# EAGLE board beads_v51 (EAGLE 9.0.1)
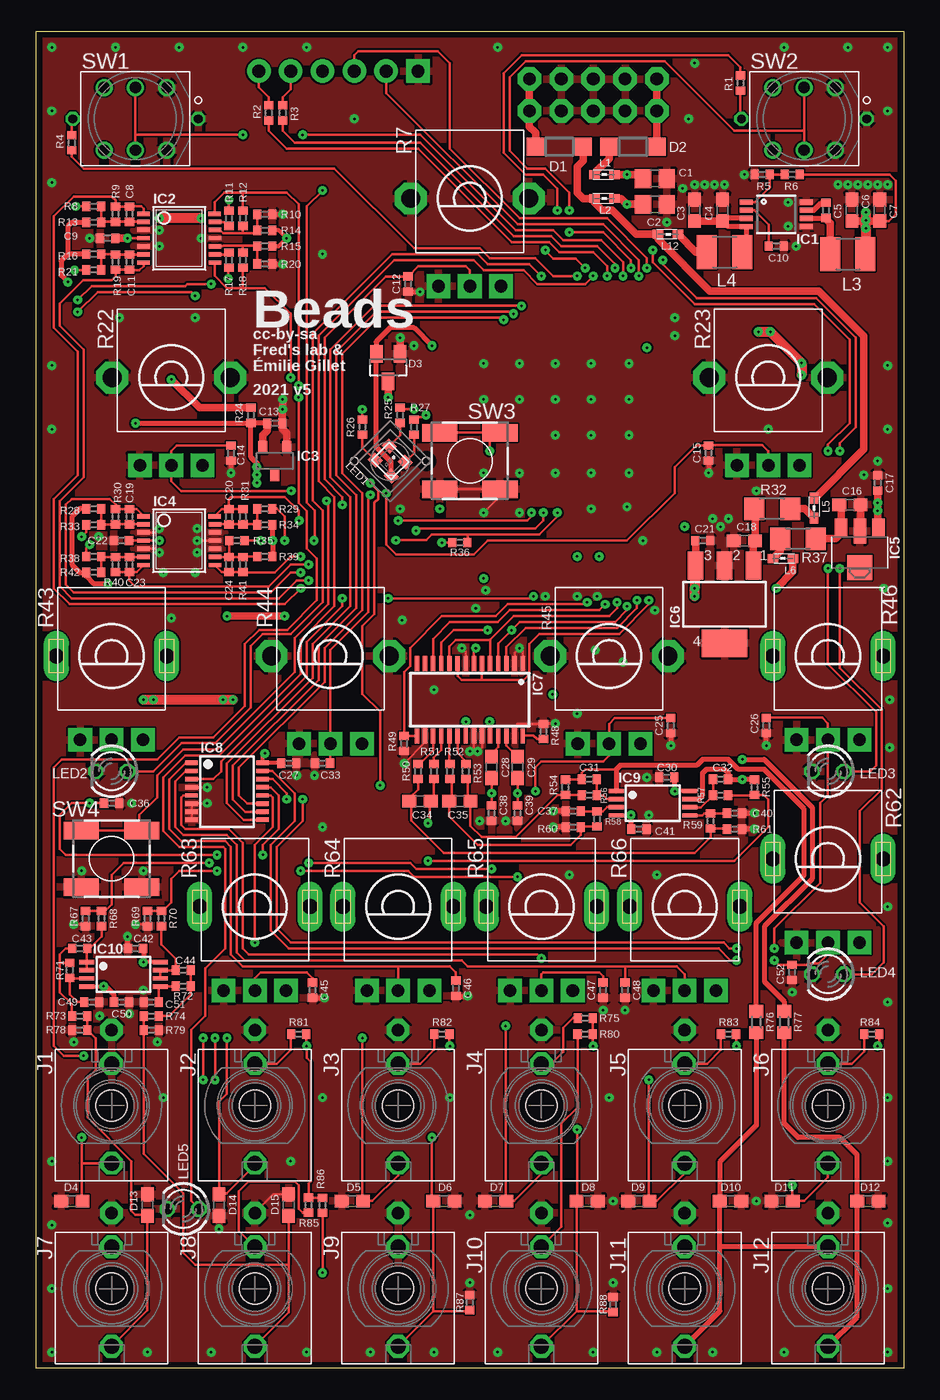
[diagram p8: board, top side]
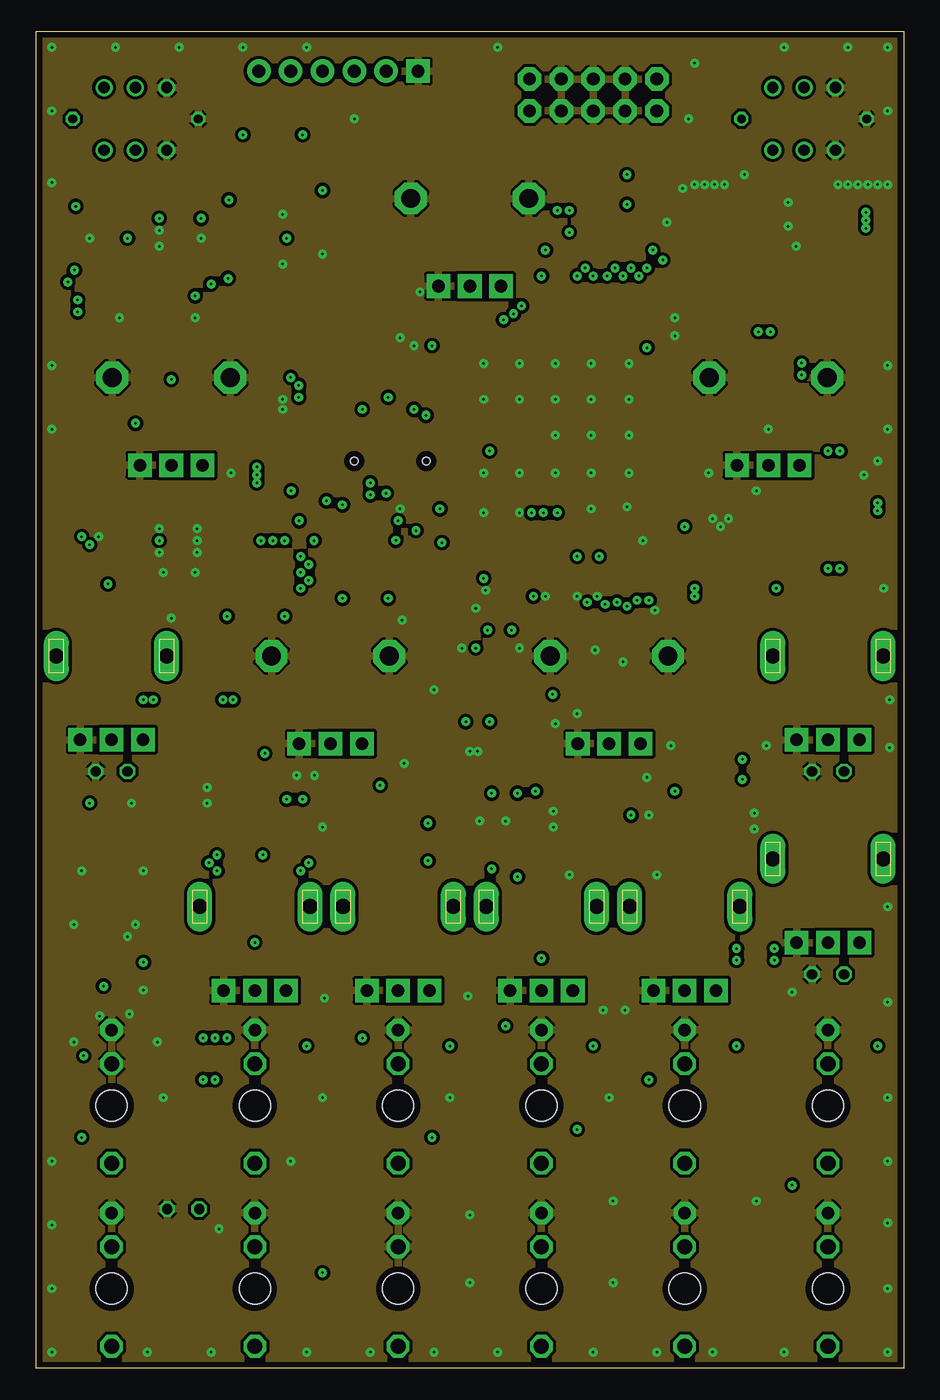
[diagram p9: board, inner layer GND]
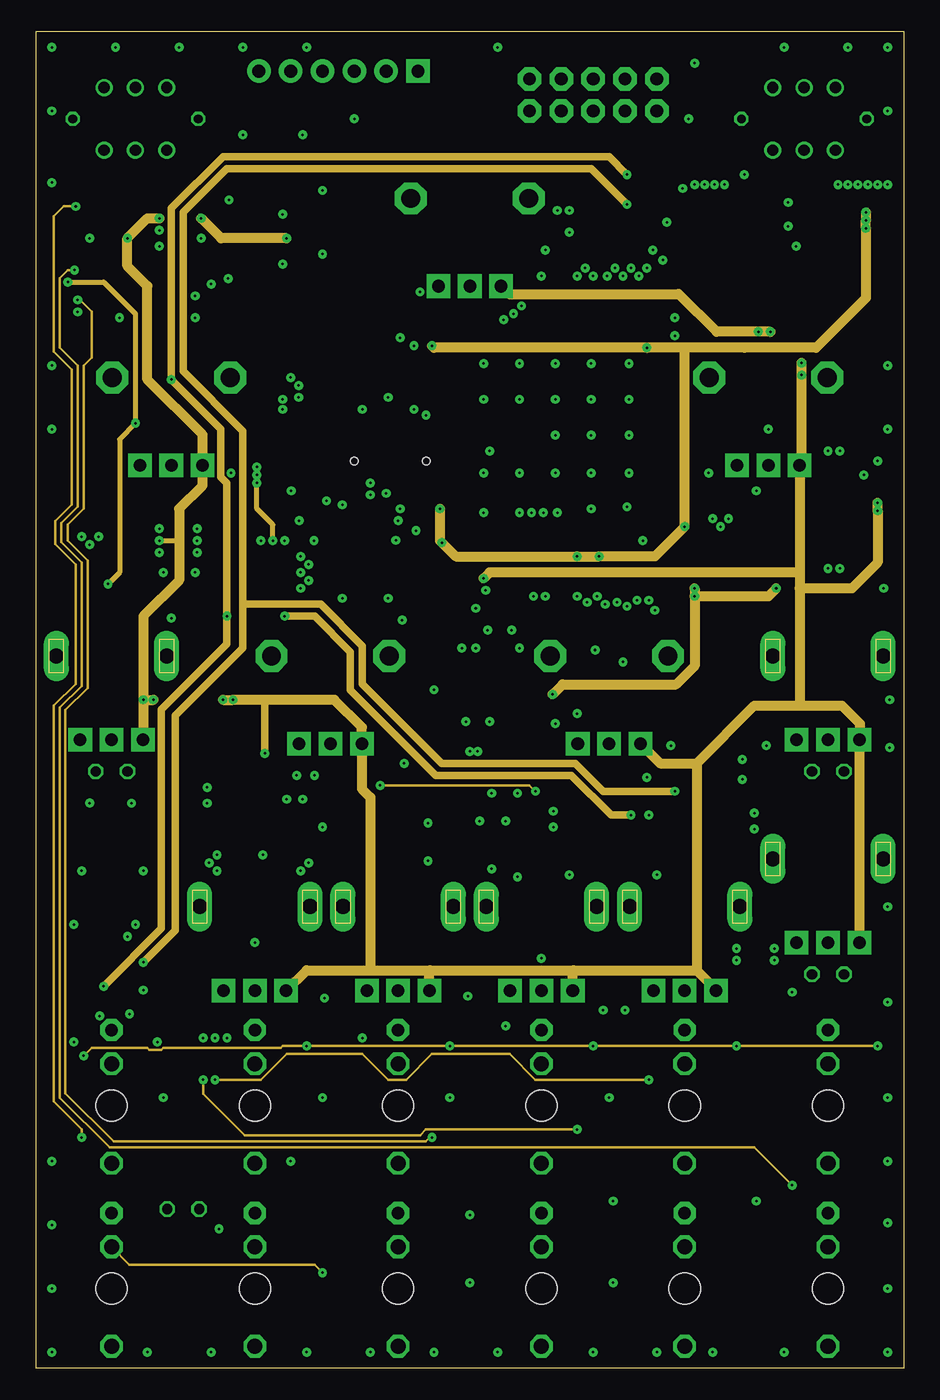
[diagram p10: board, inner layer Supplies+LongTraces]
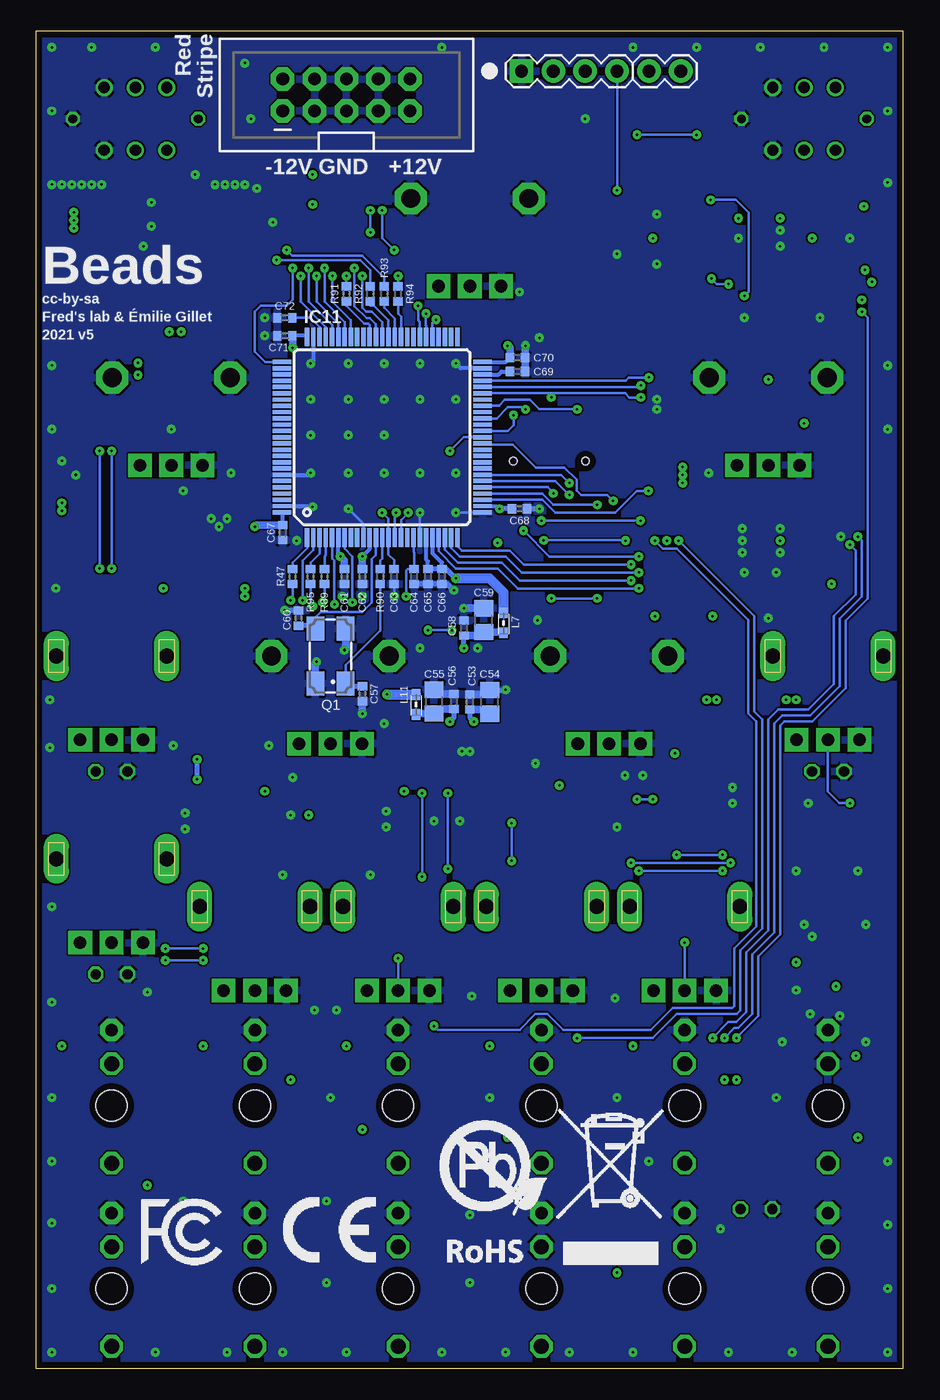
[diagram p11: board, bottom side, seen from below]

Size 69.2 x 106.68 mm. Coordinates in mm from the lower left corner, seen from the top.
Outline: 69.2,0 0,0 0,106.68 69.2,106.68 69.2,0
Copper layers (1+(2*15)+16): Top 0.035mm / dielectric 1.5mm / GND 0.035mm / dielectric 0.15mm / Supplies+LongTraces 0.035mm / dielectric 0.2mm / Bottom 0.035mm
Design rules "PCBCart-Standard-Fine *": minimum track width 8mil, minimum drill 0.2mm, track to track 5.5mil, track to pad 5.5mil, pad to pad 5.5mil, via to via 5.5mil, smd to smd 5.5mil, copper to edge 20mil, drill to drill 5.5mil, minimum pad ring 8mil, minimum via ring 10mil, stop-mask expansion 3mil, vias tented up to drill 25mil, thermal gap 8mil

## Footprints (pad centres in the part's own frame; a part is rotated, then mirrored left to right if it is on the bottom)
C0805 = smd 1.3 x 1.5: 1 -0.95,0; 2 0.95,0
C0603 = smd 1.1 x 1: 1 -0.85,0; 2 0.85,0
C0402 = smd 0.65 x 0.75: 1 -0.6,0; 2 0.6,0
SOD123 = smd 1.4 x 1.4: A 1.9,0; C -1.9,0
SOT23 = smd 1 x 1.4: 1 -0.95,-1.1; 2 0.95,-1.1; 3 0,1.1
0603 = smd 1.1 x 1: 1 -0.85,0; 2 0.85,0
MSOP-8 = smd 0.41 x 1.02: 1 -0.975,-2.4; 2 -0.325,-2.4; 3 0.325,-2.4; 4 0.975,-2.4; 5 0.975,2.4; 6 0.325,2.4; 7 -0.325,2.4; 8 -0.975,2.4
TSSOP14_065 = smd 0.35 x 1: 1 -1.95,-2.845; 2 -1.3,-2.845; 3 -0.65,-2.845; 4 0,-2.845; 5 0.65,-2.845; 6 1.3,-2.845; 7 1.95,-2.845; 8 1.95,2.845; 9 1.3,2.845; 10 0.65,2.845; 11 0,2.845; 12 -0.65,2.845; 13 -1.3,2.845; 14 -1.95,2.825
DBZ_R-PDSO-G3 = smd 0.7 x 1: 1 -0.95,-1.1; 2 0.95,-1.1; 3 0,1.1
SOT89 = smd 1 x 1.5: 1 -1.499,-1.981; 3 1.499,-1.981 | smd 1 x 2: 2 0,-1.727 | smd 2 x 2: 2@1 0,1.194
SOT223 = smd 1.219 x 2.235: 1 -2.311,-3.099; 2 0,-3.099; 3 2.311,-3.099 | smd 3.6 x 2.2: 4 0,3.099
TSSOP28 = smd 0.35 x 1.2: 1 -4.225,-2.9; 2 -3.575,-2.9; 3 -2.925,-2.9; 4 -2.275,-2.9; 5 -1.625,-2.9; 6 -0.975,-2.9; 7 -0.325,-2.9; 8 0.325,-2.9; 9 0.975,-2.9; 10 1.625,-2.9; 11 2.275,-2.9; 12 2.925,-2.9; 13 3.575,-2.9; 14 4.225,-2.9; 15 4.225,2.9; 16 3.575,2.9; 17 2.925,2.9; 18 2.275,2.9; 19 1.625,2.9; 20 0.975,2.9; 21 0.325,2.9; 22 -0.325,2.9; 23 -0.975,2.9; 24 -1.625,2.9; 25 -2.275,2.9; 26 -2.925,2.9; 27 -3.575,2.9; 28 -4.225,2.9
TSSOP16_065 = smd 0.35 x 1: 1 -1.95,-2.825; 2 -1.3,-2.825; 3 -0.65,-2.825; 4 0,-2.825; 5 0.65,-2.825; 6 1.3,-2.825; 7 1.95,-2.825; 8 2.6,-2.825; 9 2.6,2.825; 10 1.95,2.825; 11 1.3,2.825; 12 0.65,2.825; 13 0,2.825; 14 -0.65,2.825; 15 -1.3,2.825; 16 -1.95,2.825
TSSOP08 = smd 0.35 x 1.2: 1 -0.975,-2.925; 2 -0.325,-2.925; 3 0.325,-2.925; 4 0.975,-2.925; 5 0.975,2.925; 6 0.325,2.925; 7 -0.325,2.925; 8 -0.975,2.925
TQFP100 = smd 1.5 x 0.35: 1 -8,6; 2 -8,5.5; 3 -8,5; 4 -8,4.5; 5 -8,4; 6 -8,3.5; 7 -8,3; 8 -8,2.5; 9 -8,2; 10 -8,1.5; 11 -8,1; 12 -8,0.5; 13 -8,0; 14 -8,-0.5; 15 -8,-1; 16 -8,-1.5; 17 -8,-2; 18 -8,-2.5; 19 -8,-3; 20 -8,-3.5; 21 -8,-4; 22 -8,-4.5; 23 -8,-5; 24 -8,-5.5; 25 -8,-6; 51 8,-6; 52 8,-5.5; 53 8,-5; 54 8,-4.5; 55 8,-4; 56 8,-3.5; 57 8,-3; 58 8,-2.5; 59 8,-2; 60 8,-1.5; 61 8,-1; 62 8,-0.5; 63 8,0; 64 8,0.5; 65 8,1; 66 8,1.5; 67 8,2; 68 8,2.5; 69 8,3; 70 8,3.5; 71 8,4; 72 8,4.5; 73 8,5; 74 8,5.5; 75 8,6 | smd 0.35 x 1.5: 26 -6,-8; 27 -5.5,-8; 28 -5,-8; 29 -4.5,-8; 30 -4,-8; 31 -3.5,-8; 32 -3,-8; 33 -2.5,-8; 34 -2,-8; 35 -1.5,-8; 36 -1,-8; 37 -0.5,-8; 38 0,-8; 39 0.5,-8; 40 1,-8; 41 1.5,-8; 42 2,-8; 43 2.5,-8; 44 3,-8; 45 3.5,-8; 46 4,-8; 47 4.5,-8; 48 5,-8; 49 5.5,-8; 50 6,-8; 76 6,8; 77 5.5,8; 78 5,8; 79 4.5,8; 80 4,8; 81 3.5,8; 82 3,8; 83 2.5,8; 84 2,8; 85 1.5,8; 86 1,8; 87 0.5,8; 88 0,8; 89 -0.5,8; 90 -1,8; 91 -1.5,8; 92 -2,8; 93 -2.5,8; 94 -3,8; 95 -3.5,8; 96 -4,8; 97 -4.5,8; 98 -5,8; 99 -5.5,8; 100 -6,8
WQP_PJ_301M_TME = drill 1 pad 1.778 octagon: P1 0,-6.032 | drill 1.2 pad 1.778 octagon: P2 0,-3.334; P3 0,4.604 | hole 2.5: 0,0
2X5-SHROUDED = drill 1.016 pad 1.88 octagon: 1 -1.27,5.08; 2 1.27,5.08; 3 -1.27,2.54; 4 1.27,2.54; 5 -1.27,0; 6 1.27,0; 7 -1.27,-2.54; 8 1.27,-2.54; 9 -1.27,-5.08; 10 1.27,-5.08
1X04 = drill 1.016 pad 1.88 square: 1 0,0 | drill 1.016 pad 1.88: 2 2.54,0; 3 5.08,0; 4 7.62,0
1X02 = drill 1.016 pad 1.88: 1 0,0; 2 2.54,0
0603' = smd 0.85 x 0.7: 1 -0.9,0; 2 0.7,0
R1210 = smd 1.6 x 2.7: 1 -1.4,0; 2 1.4,0
PLCC-4-2220 = smd 0.9 x 0.8: 1 0.9,-0.8; 2 0.9,0.8; 3 -0.9,0.8; 4 -0.9,-0.8
LED3MM = drill 0.813 octagon: A -1.27,0; K 1.27,0
CTS406 = smd 1.9 x 1.4: 1 -2.2,-1.2; 2 2.2,-1.2; 3 2.2,1.2; 4 -2.2,1.2
R0402 = smd 0.65 x 0.75: 1 -0.6,0; 2 0.6,0
ALPS_POT_VERTICAL_PS = drill 1 pad 1.88 square: P$1 -2.5,7; P$2 0,7; P$3 2.5,7 | drill 1.5 pad 2.54 octagon: P$4 -4.7,0; P$5 4.7,0
R1206 = smd 1.6 x 1.803: 1 -1.422,0; 2 1.422,0
ALPS_POT_NARROW = drill 1 pad 1.88 square: P$1 -2.5,6.7; P$2 0,6.7; P$3 2.5,6.7 | drill 1.2 pad 2 long: P$4 -4.4,0; P$5 4.4,0
R0603 = smd 1 x 1.1: 1 -0.85,0; 2 0.85,0
LP4OA1PBCT = drill 0.7 octagon: L1 5,0; L2 -5,0 | drill 0.9: P1 2.5,2.5; P2 0,2.5; P3 -2.5,2.5; P4 2.5,-2.5; P5 0,-2.5; P6 -2.5,-2.5
TACTILE_SWITCH_SMD_JLEAD = smd 2.8 x 1.4: 1 -2.41,2.25; 2 2.41,2.25; 3 -2.41,-2.25; 4 2.41,-2.25
VLP-XXX-X = hole 0.6: 2.032,2.032; -2.032,-2.032

## Placement (x,y rotation side)
C1  10u  [C0805]  49.35,94.93 180 top
C2  10u  [C0805]  49.35,92.87 0 top
C3  10u  [C0603]  52.53,92.39 90 top
C4  10u  [C0603]  54.75,92.39 90 top
C5  100n  [C0402]  63,92.39 270 top
C6  10u  [C0603]  65.07,92.39 90 top
C7  10u  [C0603]  67.29,92.39 90 top
C8  1.0n  [C0402]  7.44,92.08 90 top
C9  100n  [C0402]  5.7,90.17 180 top
C10  2.2u  [C0402]  59.03,89.53 0 top
C11  1.0n  [C0402]  7.44,88.27 270 top
C12  100n  [C0402]  29.67,86.52 270 top
C13  100n  [C0402]  19.03,75.41 0 top
C14  100n  [C0402]  15.54,73.03 270 top
C15  100n  [C0402]  53.64,73.03 270 top
C16  10u  [C0603]  64.91,68.9 0 top
C17  2.2u  [C0402]  67.13,70.64 90 top
C18  10u  [C0603]  56.49,66.04 180 top
C19  1.0n  [C0402]  7.44,67.94 90 top
C20  2.2n  [C0402]  15.38,67.94 90 top
C21  100n  [C0402]  53.16,66.04 0 top
C22  100n  [C0402]  6.81,66.04 180 top
C23  2.2n  [C0402]  7.44,64.14 270 top
C24  2.2n  [C0402]  15.38,64.14 270 top
C25  100n  [C0402]  50.62,51.28 270 top
C26  100n  [C0402]  58.24,51.28 270 top
C27  100n  [C0402]  20.14,48.26 0 top
C28  10u  [C0603]  36.33,47.94 90 top
C29  10u  [C0603]  38.4,47.94 90 top
C30  100n  [C0402]  50.3,47.15 180 top
C31  220p  [C0402]  44.11,46.99 180 top
C32  220p  [C0402]  54.59,46.99 0 top
C33  100n  [C0402]  22.84,48.26 180 top
C34  2.2n  [C0603]  30.62,45.24 180 top
C35  2.2n  [C0603]  33.79,45.24 180 top
C36  100n  [C0402]  6.01,45.09 0 top
C37  220p  [C0402]  42.84,44.45 180 top
C38  1.2n  [C0402]  36.33,44.29 270 top
C39  1.2n  [C0402]  38.4,44.29 270 top
C40  220p  [C0402]  55.7,44.29 0 top
C41  100n  [C0402]  48.08,43.02 180 top
C42  100n  [C0402]  7.92,33.5 180 top
C43  680p  [C0402]  3.47,33.5 0 top
C44  680p  [C0402]  11.73,31.75 180 top
C45  100n  [C0402]  22.05,30.16 270 top
C46  100n  [C0402]  33.48,30.32 270 top
C47  100n  [C0402]  45.22,30.16 270 top
C48  100n  [C0402]  46.97,30.16 270 top
C49  330p  [C0402]  4.43,29.21 0 top
C50  100n  [C0402]  6.81,29.21 180 top
C51  330p  [C0402]  9.19,29.21 180 top
C52  100n  [C0402]  60.3,31.59 270 top
C53  100n  [C0402]  34.59,53.17 90 bottom
C54  47u  [C0805]  33,53.17 90 bottom
C55  47u  [C0805]  37.45,53.19 90 bottom
C56  100n  [C0402]  35.86,53.19 90 bottom
C57  18p  [C0402]  43.16,53.82 270 bottom
C58  100n  [C0402]  35.06,59.06 90 bottom
C59  47u  [C0805]  33.48,59.69 90 bottom
C60  18p  [C0402]  48.24,59.85 90 bottom
C61  100n  [C0402]  44.59,63.18 270 bottom
C62  100n  [C0402]  43.16,63.18 270 bottom
C63  100n  [C0402]  40.62,63.18 270 bottom
C64  1.2n  [C0402]  39.03,63.18 270 bottom
C65  100n  [C0402]  37.92,63.18 270 bottom
C66  2.2u  [C0402]  36.81,63.18 270 bottom
C67  100n  [C0402]  49.51,66.67 270 bottom
C68  100n  [C0402]  30.62,68.58 0 bottom
C69  2.2u  [C0402]  30.78,79.53 0 bottom
C70  100n  [C0402]  30.78,80.64 0 bottom
C71  100n  [C0402]  49.35,82.39 180 bottom
C72  2.2u  [C0402]  49.35,83.82 180 bottom
D1  1N5819HW  [SOD123]  41.73,97.47 180 top
D2  1N5819HW  [SOD123]  47.6,97.47 180 top
D3  BAT54S  [SOT23]  28.08,79.85 180 top
D4  16V  [0603]  2.84,13.34 0 top
D5  16V  [0603]  25.22,13.34 0 top
D6  16V  [0603]  32.52,13.34 180 top
D7  16V  [0603]  36.65,13.34 0 top
D8  16V  [0603]  43.95,13.34 180 top
D9  16V  [0603]  48.08,13.34 0 top
D10  16V  [0603]  55.38,13.34 180 top
D11  16V  [0603]  59.51,13.34 0 top
D12  16V  [0603]  66.34,13.34 180 top
D13  16V  [0603]  8.87,13.02 270 top
D14  16V  [0603]  14.59,13.02 90 top
D15  16V  [0603]  20.14,13.02 270 top
IC1  MCP16311MS  [MSOP-8]  59.03,92.08 270 top
IC2  MCP6004  [TSSOP14_065]  11.41,90.17 270 top
IC3  LM4040B10  [DBZ_R-PDSO-G3]  19.03,72.39 180 top
IC4  MCP6004  [TSSOP14_065]  11.41,66.04 270 top
IC5  LD2981ABU33  [SOT89]  65.7,65.09 180 top
IC6  UA78M05DCY  [SOT223]  54.91,60.96 180 top
IC7  PCM3060  [TSSOP28]  34.59,53.34 180 top
IC8  4051PW  [TSSOP16_065]  15.22,46.35 270 top
IC9  NJM2068  [TSSOP08]  49.19,45.09 270 top
IC10  NJM2068  [TSSOP08]  6.97,31.43 270 top
IC11  STM32H743VIT6  [TQFP100]  41.57,74.29 90 bottom
J1  PJ301_THONKICONNTME  [WQP_PJ_301M_TME]  6.01,20.95 180 top
J2  PJ301_THONKICONNTME  [WQP_PJ_301M_TME]  17.44,20.95 180 top
J3  PJ301_THONKICONNTME  [WQP_PJ_301M_TME]  28.87,20.95 180 top
J4  PJ301_THONKICONNTME  [WQP_PJ_301M_TME]  40.3,20.95 180 top
J5  PJ301_THONKICONNTME  [WQP_PJ_301M_TME]  51.73,20.95 180 top
J6  PJ301_THONKICONNTME  [WQP_PJ_301M_TME]  63.16,20.95 180 top
J7  PJ301_THONKICONNTME  [WQP_PJ_301M_TME]  6.01,6.35 180 top
J8  PJ301_THONKICONNTME  [WQP_PJ_301M_TME]  17.44,6.35 180 top
J9  PJ301_THONKICONNTME  [WQP_PJ_301M_TME]  28.87,6.35 180 top
J10  PJ301_THONKICONNTME  [WQP_PJ_301M_TME]  40.3,6.35 180 top
J11  PJ301_THONKICONNTME  [WQP_PJ_301M_TME]  51.73,6.35 180 top
J12  PJ301_THONKICONNTME  [WQP_PJ_301M_TME]  63.16,6.35 180 top
JP1  M05X2SHD  [2X5-SHROUDED]  44.43,101.6 90 bottom
JP2  [1X04]  30.46,103.5 0 bottom
JP3  [1X02]  20.3,103.5 0 bottom
L1  1k@1MHz  [0603']  45.22,95.25 180 top
L2  1k@1MHz  [0603']  45.22,93.34 180 top
L3  15u/0.73A  [R1210]  64.75,88.9 0 top
L4  1u/0.75A  [R1210]  54.91,89.06 0 top
L5  1k@1MHz  [0603']  62.05,68.74 90 top
L6  1k@1MHz  [0603']  59.67,64.61 0 top
L7  1k@1MHz  [0603']  31.89,59.37 270 bottom
L11  1k@1MHz  [0603']  38.87,52.86 270 bottom
L12  1k@1MHz  [0603']  50.3,90.49 180 top
LED1  ASMB-KTF0-0A306  [PLCC-4-2220]  28.24,72.39 315 top
LED2  INL-3AW30  [LED3MM]  6.01,47.62 180 top
LED3  INL-3AW30  [LED3MM]  63.16,47.62 180 top
LED4  INL-3AW30  [LED3MM]  63.16,31.43 180 top
LED5  INL-3AW30  [LED3MM]  11.73,12.7 180 top
Q1  8MHz  [CTS406]  45.7,56.83 90 bottom
R1  39  [R0402]  56.18,102.55 90 top
R2  220  [R0402]  18.55,100.17 270 top
R3  220  [R0402]  19.66,100.17 270 top
R4  39  [R0402]  2.84,97.79 270 top
R5  10k  [R0402]  57.92,95.25 180 top
R6  31.6k  [R0402]  60.3,95.25 180 top
R7  10kB  [ALPS_POT_VERTICAL_PS]  34.59,93.34 180 top
R8  100k  [R0402]  4.58,92.71 0 top
R9  33k  [R0402]  6.33,92.08 90 top
R10  1.0k  [R0402]  18.24,92.08 180 top
R11  10k  [R0402]  15.38,91.76 270 top
R12  33k  [R0402]  16.49,91.76 90 top
R13  200k  [R0402]  4.58,91.44 0 top
R14  10k  [R0402]  18.24,90.81 0 top
R15  10k  [R0402]  18.24,89.53 0 top
R16  200k  [R0402]  4.58,88.9 0 top
R17  10k  [R0402]  15.38,88.42 90 top
R18  33k  [R0402]  16.49,88.42 270 top
R19  33k  [R0402]  6.33,88.27 270 top
R20  1.0k  [R0402]  18.24,88.11 180 top
R21  100k  [R0402]  4.58,87.63 0 top
R22  10kB  [ALPS_POT_VERTICAL_PS]  10.78,79.06 180 top
R23  10kB  [ALPS_POT_VERTICAL_PS]  58.4,79.06 180 top
R24  2.0k  [R0402]  17.12,76.04 270 top
R25  2.0k  [R0402]  29.03,76.04 270 top
R26  2.0k  [R0402]  26.02,75.09 270 top
R27  2.0k  [R0402]  30.14,75.09 270 top
R28  200k  [R0402]  4.58,68.58 0 top
R29  100k  [R0402]  18.24,68.58 180 top
R30  33k  [R0402]  6.33,67.94 90 top
R31  20k  [R0402]  16.49,67.94 90 top
R32  33  [R1206]  58.72,68.58 0 top
R33  100k  [R0402]  4.58,67.31 0 top
R34  120k  [R0402]  18.24,67.31 180 top
R35  100k  [R0402]  16.01,66.04 180 top
R36  10k  [R0402]  33.79,65.88 0 top
R37  33  [R1206]  60.78,66.2 180 top
R38  100k  [R0402]  4.58,64.77 0 top
R39  120k  [R0402]  18.24,64.77 180 top
R40  20k  [R0402]  6.33,64.14 270 top
R41  20k  [R0402]  16.49,64.14 270 top
R42  120k  [R0402]  4.58,63.5 0 top
R43  10kB  [ALPS_POT_NARROW]  6.01,56.83 180 top
R44  10kB  [ALPS_POT_VERTICAL_PS]  23.48,56.83 180 top
R45  10kB  [ALPS_POT_VERTICAL_PS]  45.7,56.83 180 top
R46  10kB  [ALPS_POT_NARROW]  63.16,56.83 180 top
R47  100  [R0402]  48.72,63.18 270 bottom
R48  220k  [R0402]  40.46,50.8 270 top
R49  10k  [R0402]  29.35,49.85 90 top
R50  12k  [R0402]  30.46,47.62 270 top
R51  12k  [R0402]  31.73,47.62 270 top
R52  12k  [R0402]  33,47.62 270 top
R53  12k  [R0402]  34.27,47.62 270 top
R54  30k  [R0402]  42.21,46.35 90 top
R55  30k  [R0402]  57.29,46.35 90 top
R56  1.0k  [R0402]  44.12,45.72 0 top
R57  1.0k  [R0402]  54.59,45.72 180 top
R58  1.0k  [R0402]  44.75,43.81 90 top
R59  1.0k  [R0402]  53.8,43.66 90 top
R60  30k  [R0402]  42.84,43.18 0 top
R61  30k  [R0402]  55.7,43.02 180 top
R62  10kB  [ALPS_POT_NARROW]  63.16,40.64 180 top
R63  10kB  [ALPS_POT_NARROW]  17.44,36.83 180 top
R64  10kB  [ALPS_POT_NARROW]  28.87,36.83 180 top
R65  10kB  [ALPS_POT_NARROW]  40.3,36.83 180 top
R66  10kB  [ALPS_POT_NARROW]  51.73,36.83 180 top
R67  2.0k  [R0402]  3.95,35.88 90 top
R68  10k  [R0402]  5.22,35.88 90 top
R69  2.0k  [R0402]  8.87,35.88 90 top
R70  10k  [R0402]  9.98,35.88 90 top
R71  8.2k  [R0402]  2.68,31.75 270 top
R72  8.2k  [R0402]  11.73,30.48 180 top
R73  12k  [R0402]  3.47,28.1 180 top
R74  12k  [R0402]  9.19,28.1 0 top
R75  10k  [R0402]  43.79,27.94 180 top
R76  1.0k  [R0603]  57.45,27.62 90 top
R77  1.0k  [R0603]  59.67,27.62 90 top
R78  100k  [R0402]  3.47,26.99 0 top
R79  100k  [R0402]  9.19,26.99 180 top
R80  10k  [R0402]  43.78,26.67 180 top
R81  10k  [R0402]  20.93,26.67 180 top
R82  10k  [R0402]  32.36,26.67 180 top
R83  10k  [R0402]  55.22,26.67 180 top
R84  10k  [R0402]  66.66,26.67 180 top
R85  1.0M  [R0402]  21.73,13.02 270 top
R86  1.0M  [R0402]  22.84,13.01 270 top
R87  100k  [R0402]  34.59,5.24 270 top
R88  100k  [R0402]  46.02,5.08 270 top
R89  100  [R0402]  46.18,63.18 270 bottom
R90  220  [R0402]  41.73,63.18 270 bottom
R91  2.0k  [R0402]  44.43,85.72 90 bottom
R92  2.0k  [R0402]  42.52,85.72 90 bottom
R93  2.0k  [R0402]  41.41,85.72 90 bottom
R94  2.0k  [R0402]  40.3,85.72 90 bottom
R95  100  [R0402]  47.29,63.18 270 bottom
SW1  LP4OA1PBCT  [LP4OA1PBCT]  7.92,99.69 180 top
SW2  LP4OA1PBCT  [LP4OA1PBCT]  61.26,99.69 180 top
SW3  [TACTILE_SWITCH_SMD_JLEAD]  34.59,72.39 180 top
SW4  [TACTILE_SWITCH_SMD_JLEAD]  6.01,40.64 180 top
U$1  [VLP-XXX-X]  28.24,72.39 135 top
U$2  [ROHS_BIG]  38.24,7.46 0 bottom
U$3  [FCC_MEDIUM]  60.78,8.26 0 bottom
U$4  [CE_MEDIUM]  49.51,8.41 0 bottom

## Tracks (layer width: path | path; a pad name or v marks a point on that pad's centre or on a via)
+3V3  (via drill 0.2)
  Top 0.203: R6.1 68.08,95.25 68.56,94.77 68.56,92.08 68.03,91.54 C7.1 | D3.2 | v32.36,65.88 R36.1
  Top 0.406: v31.57,81.6 30.14,83.03 28.24,83.03 27.13,81.92 D3.2 27.13,73.5 28.31,72.32 LED1.1
  Top 0.61: 66.18,91.54 C7.1 | 66.18,91.54 C6.1 | v66.18,91.6 66.18,91.54 | 66.18,88.93 L3.2
  Top 0.813: 66.18,91.54 v66.18,90.96 66.18,88.93 | v66.18,92.23 v66.18,91.6
  Supplies+LongTraces 0.203: v32.36,65.88 32.21,66.04
  Supplies+LongTraces 0.813: 51.73,81.44 56.49,81.44 62.21,81.44 66.18,85.41 v66.18,90.96 v66.18,91.6 v66.18,92.23 | v31.57,81.6 31.73,81.44 v48.72,81.44 51.73,81.44 | v32.21,68.58 32.21,66.04 33.48,64.77 v43.16,64.77 v44.91,64.77 49.35,64.77 v51.73,67.15 51.73,73.5 51.73,81.44
  Bottom 0.203: 43.16,64.78 v43.16,64.77 | v44.91,64.77 45.07,64.94 | v32.22,68.58 v32.21,68.58
  Bottom 0.305: IC11.27 32.44,68.8 v32.22,68.58 | IC11.11 42.57,65.37 43.16,64.78 | 45.07,64.94 IC11.6 | IC11.75 47.67,82.39 C71.1 | IC11.50 31.73,80.3 C70.1 | C67.1 49.51,68.23 IC11.100
  Bottom 0.406: C68.1 v32.21,68.58
  Bottom 0.61: C71.1 48.72,82.36 v48.72,81.44 | v44.91,64.77 44.59,64.45 C61.1 | v43.16,64.77 C62.1 | C70.1 31.38,81.4 v31.57,81.6 | C67.1 51.61,67.28 v51.73,67.15
+3V3_A  (via drill 0.2)
  Top 0.203: 67.13,67.14 IC5.1 | IC2.4 v7.28,90.17 | IC4.4 v9.82,66.04 | IC4.4 | IC4.4 C22.1
  Top 0.305: C27.1 19.5,48.3 IC8.16 18.05,48.86 v18.24,49.05 | R14.2 19.35,90.81 v19.98,90.17 19.35,89.53 R15.2 | C22.1
  Top 0.61: 67.13,67.14 v67.13,68.42 C17.1 | v7.28,90.17 C9.1
  Top 0.813: v13.16,91.76 v9.82,91.76 | v15.7,53.34 v8.55,53.34 | v57.61,82.71 v58.56,82.71 v61.06,80.21 v61.06,79.26
  Supplies+LongTraces 0.406: v9.82,66.04 11.41,66.04
  Supplies+LongTraces 0.61: 18.24,53.34 v18.24,49.05
  Supplies+LongTraces 0.813: 52.68,48.26 57.29,52.86 60.9,52.86 | 60.9,52.86 64.27,52.86 65.7,51.44 65.7,50.17 R46.P$1 R62.P$1 | v19.98,90.17 14.74,90.17 v13.16,91.76 | v9.82,91.76 8.87,91.76 v7.28,90.17 7.28,87.95 8.87,86.36 8.87,78.9 13.28,74.49 R22.P$1 13.28,70.44 11.41,68.58 11.41,66.04 11.41,62.87 8.55,60.01 v8.55,53.34 | v61.06,80.21 61.06,72.22 R23.P$1 60.9,63.54 | v58.56,82.71 54.27,82.71 51.26,85.72 37.71,85.72 R7.P$1 | v8.55,53.34 8.55,50.17 R43.P$1 | v35.7,63.02 36.17,63.5 60.86,63.5 60.9,63.54 | R63.P$1 21.56,31.75 26.65,31.75 | 26.65,31.75 26.65,45.56 25.98,46.24 R44.P$1 25.98,51.16 23.79,53.34 18.24,53.34 v15.7,53.34 v14.9,53.34 | 60.9,63.54 60.9,62.23 | 60.9,62.23 65.07,62.23 67.13,64.29 v67.13,68.42 v67.13,69.06 | 60.9,62.23 60.9,52.86 | R66.P$1 54.23,30.2 52.68,31.75 | 26.65,31.75 31.41,31.75 | 31.41,31.75 42.84,31.75 | R65.P$1 42.8,31.71 42.84,31.75 | R64.P$1 31.37,31.71 31.41,31.75 | v8.55,53.34 v9.35,53.34 | R45.P$1 49.77,48.26 52.68,48.26 | 42.84,31.75 52.68,31.75 | 52.68,48.26 52.68,31.75
  Bottom 0.305: IC11.21 37.57,65.06 36.81,64.29 C66.1 | IC11.20 38.07,64.55 37.92,64.4 C65.1
  Bottom 0.406: v35.7,63.02 36.46,63.78 C66.1 C65.1
  Bottom 0.813: L7.1 31.89,61.91 33,63.02 v35.7,63.02
+5V_A  (via drill 0.2)
  Top 0.61: 52.53,63.99 IC6.3 52.6,66 C21.1 | v59.03,62.23 60.37,63.56 L6.2
  Top 0.813: 52.53,63.99 v52.53,62.23 v52.53,61.59
  Supplies+LongTraces 0.813: v52.53,61.59 52.53,56.04 51.04,54.56 42,54.56 v41.2,53.76 | v52.53,61.59 58.4,61.59 v59.03,62.23 | v52.53,62.23 v52.53,61.59
  Bottom 0.813: v41.2,53.76 L11.1
-10V  (via drill 0.2)
  Top 0.406: v17.6,70.64 17.6,72.23 17.12,72.71 R24.2 | R16.1 2.52,88.9 | R24.2 18.46,75.44 C13.1 | R34.1 18.87,67.28 v18.87,66.04 18.87,64.81 R39.1 | 2.52,88.9 2.52,91.12 2.84,91.44 R13.1 | v7.92,75.41 17.09,75.41 R24.2 | v5.73,62.58 4.6,62.58 3.98,63.2 R42.1 3.47,63.5 2.84,64.14 2.84,67.94 3.47,68.58 R28.1 | 2.52,88.9 1.98,88.36 1.98,87.22 v2.52,86.68
  Top 0.61: IC3.2 18.08,74.45 18.43,74.81 C13.1
  Supplies+LongTraces 0.406: v17.6,71.91 v17.6,71.28 v17.6,70.64 17.6,68.58 18.87,67.31 v18.87,66.04 | v2.52,86.68 5.38,86.68 7.92,84.14 v7.92,75.41 6.65,74.14 6.65,63.5 v5.73,62.58
ASSIGN_CV  (via drill 0.2)
  Top 0.203: v21.09,62.23 19.82,60.96 2.67,60.96 1.4,62.23 1.4,69.37 3.31,71.28 3.31,81.12 1.4,83.03 1.4,91.91 3,93.5 6.01,93.5 6.33,93.19 R9.2 C8.2 7.48,92.71 8.39,92.71 8.57,92.54 IC2.1
  Bottom 0.203: v21.09,62.23 30.78,62.23 32.36,63.82 35.7,63.82 37.07,65.19 IC11.22
ASSIGN_LED_1
  Bottom 0.203: R94.1 40.3,84.14 40.07,83.91 IC11.60
ASSIGN_LED_2
  Bottom 0.203: R93.1 41.41,84.61 40.57,83.77 IC11.61
ASSIGN_LED_3
  Bottom 0.203: IC11.62 41.07,83.62 42.25,84.8 42.52,84.8 R92.1
ASSIGN_SW  (via drill 0.2)
  Top 0.203: v23.16,69.22 23.32,69.06 23.32,60.96 20.62,58.26 20.62,55.56 14.43,49.37 11.74,49.37 9.66,47.3 9.66,45.56 8.24,44.13 8.24,43.08 SW4.3 SW4.4
  Bottom 0.203: IC11.37 33.49,73.71 31.15,73.71 29.31,71.87 27.04,71.87 26.05,70.89 26.05,70.05 25.7,69.69 23.63,69.69 v23.16,69.22
AUDIO_INL
  Top 0.203: IC7.25 36.86,49.58 36.33,49.05 C28.2
AUDIO_INR
  Top 0.203: IC7.26 37.51,49.68 C29.2
AUDIO_MCK  (via drill 0.2)
  Top 0.203: v48.88,61.28 48.88,60.96 46.49,58.58 40.14,58.58 39.35,57.78 39.35,55.4 38.87,54.93 35.54,54.93 | 35.54,54.93 33.93,54.93 33.61,55.24 IC7.9 | IC7.6 35.54,56.24 35.54,54.93
  Bottom 0.203: v48.88,61.28 48.72,61.44 R47.2
AUDIO_MCK_RAW
  Bottom 0.203: IC11.1 47.57,65.44 48.72,64.29 R47.1
AUDIO_MISO  (via drill 0.2)
  Top 0.203: IC7.3 37.51,57.53 39.03,59.05 46.33,59.05 47.92,60.64 v47.92,61.28
  Bottom 0.203: IC11.2 47.07,65.3 47.92,64.45 v47.92,61.28
AUDIO_MOSI  (via drill 0.2)
  Top 0.203: IC7.12 31.66,58.19 33,59.53 36.81,59.53 37.76,60.48 44.91,60.48 v45.38,60.96
  Bottom 0.203: IC11.5 45.57,64.61 45.41,64.45 45.41,60.99 v45.38,60.96
AUDIO_RESET  (via drill 0.2)
  Top 0.203: v43.95,61.12 43.79,60.96 37.6,60.96 36.65,60.01 32.36,60.01 29.82,57.47 29.82,56.83 29.82,56.04 29.35,55.56 R49.2 IC7.15
  Bottom 0.203: IC11.7 44.57,65.39 43.95,64.77 v43.95,61.12
AUDIO_SCK  (via drill 0.2)
  Top 0.203: 36.21,58.1 36.21,58.14 38.08,60.01 45.7,60.01 46.33,60.64 v46.33,61.12 | 36.21,58.1 IC7.5 | IC7.10 32.96,57.59 33.48,58.1 36.21,58.1
  Bottom 0.203: v46.33,61.12 46.18,61.28 R89.2
AUDIO_SCK_RAW
  Bottom 0.203: IC11.4 46.07,64.87 46.18,64.77 R89.1
AUDIO_WS  (via drill 0.2)
  Top 0.203: v47.13,60.8 47.13,60.48 46.2,59.56 38.58,59.56 v37.92,58.9 36.86,57.84 IC7.4 | IC7.11 32.31,57.89 33.32,58.9 v36.02,58.9
  Bottom 0.203: v36.02,58.9 v37.92,58.9 | v47.13,60.8 47.29,60.96 R95.2
AUDIO_WS_RAW
  Bottom 0.203: IC11.3 46.57,65.01 47.29,64.29 R95.1
DENSITY_CV  (via drill 0.2)
  Top 0.203: v21.73,62.87 20.78,62.87 19.35,61.44 2.84,61.44 1.88,62.39 1.88,69.21 3.79,71.12 3.79,81.28 1.88,83.19 1.88,84.95 3.77,86.84 6.01,86.84 6.33,87.15 R19.2 C11.2 7.48,87.63 8.24,87.63 8.57,87.96 IC2.7
  Bottom 0.203: v21.73,62.87 30.62,62.87 32.05,64.29 35.54,64.29 36.57,65.33 IC11.23
DENSITY_POT  (via drill 0.2)
  Top 0.203: R7.P$2 34.59,87.63 34.27,87.95 30.5,87.95 C12.1 27.89,87.12 23,82.23 23,70.96 24.43,69.53 v24.43,68.9
  Bottom 0.203: v24.43,68.9 27.91,68.9 28.81,69.8 IC11.29
FEEDBACK_POT  (via drill 0.2)
  Top 0.203: IC8.13 18.71,46.35 19.35,45.72 19.35,43.02 18.08,41.75 v18.08,40.96 | C36.1 4.28,45.09 | 4.28,45.09 v4.27,45.1 | 4.28,45.09 2.84,45.09 1.89,44.13 1.89,41.43 2.36,40.96 v14.43,40.96
  Bottom 0.203: v18.08,40.96 v14.43,40.96 | R43.P$2 6.01,46.01 5.11,45.1 v4.27,45.1
FREEZE  (via drill 0.2)
  Top 0.203: 16.49,86.2 18.24,86.2 20.3,84.14 v20.3,79.06 | IC2.8 14.26,87.17 15.22,86.2 16.49,86.2 | R18.2 16.49,86.2
  Bottom 0.203: IC11.47 22.15,78.8 21.89,79.06 v20.3,79.06
FREEZE_LED  (via drill 0.2)
  Top 0.203: R4.2 2.84,96.68 3.79,95.73 23.79,95.73 30.14,89.38 35.38,89.38 36.17,88.58 39.83,88.58 41.25,87.15 v43.16,87.15
  Bottom 0.203: IC11.63 41.57,83.48 42.39,84.3 42.84,84.3 43.16,84.61 v43.16,87.15
FREEZE_SW  (via drill 0.2)
  Top 0.203: v21.25,98.42 30.62,98.42 38.24,90.81 41.25,90.81 42.05,90.01 45.06,90.01 46.81,88.27 v46.81,87.15 | 7.92,98.42 SW1.P5 | v16.49,98.42 7.92,98.42 | 7.92,98.42 SW1.P2
  Bottom 0.203: v21.25,98.42 v16.49,98.42 | IC11.70 45.07,83.35 46.81,85.09 v46.81,87.15
GND  (via drill 0.2)
  Top 0.203: v29.03,82.23 | v35.7,68.26 37,69.56 SW3.1 SW3.2 | IC3.1 | IC8.4 v13.63,46.35 | v13.63,45.09 13.6,45.05 IC8.6 IC8.7 IC8.8 | IC7.22 34.91,49.54 v34.59,49.21 | IC7.23 35.56,49.55 v35.22,49.21 | IC7.2 38.16,57.07 v38.56,57.47 38.81,57.21 IC7.1 | IC7.8 34.26,57.16 v33.95,57.47 | v9.82,66.99 9.51,66.67 8.87,66.67 8.85,66.69 IC4.3 | IC4.5 8.58,65.41 9.51,65.41 v9.82,65.09 | IC7.27 38.16,51.2 38.36,51.4 R48.1 40.5,51.44 v41.41,51.44 | v3,35.4 3.83,35.4 R67.1 | v7.92,35.4 8.75,35.4 R69.1 | D15.1 18.93,13.87 J8.P1 | v12.84,66.04 | v12.84,66.04 IC4.11 | v29.35,48.26 31.01,49.92 IC7.16
  Top 0.406: C15.2 v53.64,71.44 | v30.62,85.88 29.7,85.88 C12.2 | R10.1 v19.66,92.08 | R20.1 v19.66,88.11 | v58.24,49.69 C26.2 | C25.2 v50.62,49.69 | C14.2 v15.54,71.44 | C46.2 33.51,29.69 v34.43,29.69 | v23,29.53 22.08,29.53 C45.2 | C42.2 7.32,34.41 v7.28,34.45 | C37.2 v41.25,44.45 | R60.1 v41.25,43.18 | C40.2 v57.29,44.29 | v57.29,43.02 R61.1
  Top 0.61: D3.1 v29.03,82.23 | IC3.1 19.98,74.61 19.63,74.97 C13.2 19.63,76.48 v19.66,76.52 v19.66,77.31 | C16.2 65.76,66.87 IC5.2
  Bottom 0.203: 44.5,57.4 v44.59,57.31 | 46.9,56.27 v46.81,56.36 | IC11.94 49.56,71.28 | IC11.26 33.6,68.26 v35.7,68.26 | v40.62,61.59 C63.2 | v38.56,68.26 38.57,68.25 IC11.19 | C54.2 32.99,54.13
  Bottom 0.254: v44.27,68.58 43.07,67.38 IC11.10
  Bottom 0.305: 49.56,71.28 47.45,71.28 v47.29,71.44 | IC11.99 47.18,68.8 v47.13,68.74 | IC11.74 47.07,80.38 v47.29,80.17 | IC11.49 35.32,79.8 v35.7,80.17
  Bottom 0.406: C68.2 v29.03,68.58 | v49.35,60.48 48.27,60.48 C60.2 | 32.99,54.13 v31.73,54.13 | C64.2 C65.2 C66.2 36.37,62.58 v35.86,62.07
  Bottom 0.61: Q1.2 44.5,57.4 | Q1.4 46.9,56.27 | C69.2 C70.2 30.18,81.56 v30.14,81.6 | C57.2 v43.16,52.23 | C55.2 37.09,53.79 C56.2 | C53.2 33.35,53.77 C54.2 | C59.2 v35.06,60.64
  other vias: 64.75,94.46 67.13,94.46 65.54,94.46 66.34,94.46 67.92,94.46 52.53,94.46 53.32,94.46 54.91,94.46 54.11,94.46 56.49,95.25 50.94,83.82 50.94,82.39 43.16,61.59 44.75,61.59 57.45,70.01 48.4,66.04 3.63,39.69 8.55,39.69 44.27,80.17 41.41,80.17 38.56,80.17 41.41,77.31 44.27,74.45 47.29,77.31 38.56,77.31 35.7,77.31 44.27,77.31 47.29,74.45 41.41,74.45 44.27,71.44 41.41,71.44 38.56,71.44 35.7,71.44 12.84,66.99 12.84,65.09 4.98,66.36 9.82,90.81 9.82,89.53 13.16,90.17 4.27,90.17 66.02,71.28 5.06,28.1 3,26.04 9.66,26.04 14.59,11.11 34.59,12.22 46.02,13.34 57.45,13.34 67.92,11.59 45.22,28.57 46.97,28.57 60.3,30 48.88,44.13 48.72,47.15 22.21,47.31 7.6,45.09 20.78,47.31 35.38,43.66 37.45,43.66 7.44,28.26 8.55,30.16 34.59,6.83 46.02,6.83 11.41,105.41 1.25,105.41 1.25,94.61 64.75,105.41 52.53,104.14 1.25,1.27 8.87,1.27 21.57,1.27 31.73,1.27 44.43,1.27 53.95,1.27 67.92,1.27 67.92,105.41 67.92,16.51 67.92,29.21 1.25,16.51 67.92,36.83 67.92,80.01 58.4,74.93 22.84,43.18 22.84,21.59 33,21.59 45.7,21.59 42.52,39.37 49.51,39.37 29.19,59.69 20.3,16.51 22.84,88.9 25.38,99.69 12.68,83.82 6.65,83.82 52.05,99.69 10.14,21.59 50.3,91.44 51.57,94.14 63.96,94.46 59.99,93.03 59.99,91.12 60.62,89.53 10.14,63.5 12.68,63.5 10.78,59.85 6.33,105.41 16.49,105.41 21.57,105.41 36.81,105.41 59.67,105.41 67.92,100.33 67.92,74.93 67.61,62.23 68.08,53.34 68.08,49.53 67.92,21.59 67.92,6.35 59.67,1.27 49.51,1.27 36.81,1.27 26.65,1.27 13.95,1.27 1.25,6.35 1.25,11.43 1.25,100.33 54.59,67.15 55.22,67.79 53.95,67.79 67.13,72.39 1.25,74.93 1.25,80.01
  pour Bottom: 34.9,80.33 35.54,80.96 37.76,80.96 47.6,80.96 48.24,80.33 48.24,68.26 47.6,67.63 35.38,67.63 34.9,68.1
  pour GND (isolate 0.254): -0.02,106.68 69.2,106.68 69.2,0 -0.02,0
  pour Top: -0.02,106.68 69.2,106.68 69.2,0 -0.02,0
  pour Bottom: -0.02,106.68 69.2,106.68 69.2,0 -0.02,0
INPUT_LED
  Bottom 0.203: IC11.65 42.57,83.23 42.68,83.34 43,83.34 44.43,84.77 R91.1
MEDIA_LED_B  (via drill 0.2)
  Top 0.203: R26.1 v26.02,76.52
  Bottom 0.203: IC11.43 32.25,76.8 31.78,77.27 29.79,77.27 29.03,76.52 v26.02,76.52
MEDIA_LED_G  (via drill 0.2)
  Top 0.203: R25.1 29.16,76.52 v30.14,76.52
  Bottom 0.203: v30.14,76.52 30.3,76.68 31.57,76.68 32.45,75.8 IC11.41
MEDIA_LED_R  (via drill 0.2)
  Top 0.203: R27.1 30.34,75.88 30.94,75.88 v31.09,76.04
  Bottom 0.203: v31.09,76.04 31.09,75.25 31.55,74.8 IC11.39
MEDIA_SW  (via drill 0.2)
  Top 0.203: v36.17,73.18 36.17,74.61 36.2,74.64 SW3.3 SW3.4
  Bottom 0.203: v36.17,73.18 35.06,74.3 IC11.38
N$1
  Top 0.406: IC1.3 54.96,91.75 C4.1 55.19,91.1 IC1.4 56.63,89.39 L4.2
  Top 0.61: C3.1 C4.1
N$2  (via drill 0.2)
  Top 0.203: 31.67,4.55 D6.2 31.57,13.44 v31.57,18.41 | v13.95,86.52 12.04,86.52 11.89,86.36 4.43,86.36 v3.31,85.25 | R17.1 15.31,87.75 v15.31,86.95 | J9.P3 31.67,4.55 | 31.67,4.55 34.5,4.55 R87.2
  Supplies+LongTraces 0.203: v31.57,18.41 31.41,18.41 31.09,18.1 6.17,18.1 2.33,21.94 2.33,52.51 4.11,54.29 4.11,64.45 2.52,66.04 2.52,67.31 3.79,68.58 3.79,80.01 4.43,80.64 4.43,84.3 3.55,85.17 3.23,85.17 v3.31,85.25
  Bottom 0.203: v13.95,86.52 14.9,86.52 15.31,86.92 v15.31,86.95
N$3
  Top 0.203: IC9.5 53.14,44.11 53.28,44.26 R59.2 55.07,44.26 C40.1
N$4
  Bottom 0.203: R90.2 41.73,58.87 44.5,56.1 Q1.1
  Bottom 0.406: C57.1 44.28,54.42 Q1.1
N$5
  Top 0.203: R2.1 18.55,101.44 17.76,102.23 JP3.2
N$6
  Top 0.203: JP3.1 20.3,102.08 19.66,101.44 R3.1
N$7
  Top 0.203: IC2.2 C8.1 R9.1 5.22,91.47 R13.2 R8.2
N$8  (via drill 0.2)
  Top 0.203: v3.63,18.41 3.63,16.35 | 3.63,16.35 3.63,13.39 D4.2 | R8.1 v3.15,92.71 | J1.P3 3.63,16.35 | 3.63,16.35
  Supplies+LongTraces 0.203: v3.15,92.71 2.2,92.71 1.41,91.92 1.41,81.12 2.84,79.69 2.84,68.92 1.52,67.59 1.52,65.77 3.15,64.13 3.15,54.61 1.41,52.86 1.41,21.27 3.63,19.05 v3.63,18.41
N$9
  Top 0.203: R83.2 54.62,25.4 53.51,24.29 J5.P2
N$10
  Top 0.203: IC4.2 C19.1 R30.1 6.3,67.31 R33.2 R28.2
N$11  (via drill 0.2)
  Top 0.203: D9.2 49.03,13.34 | 49.03,13.34 49.51,13.34 51.73,15.56 J5.P3 | v48.88,23.02 48.88,13.49 49.03,13.34 | v14.27,23.02 v14.27,26.35 | v3.63,66.36 3.98,66.71 R33.1
  Supplies+LongTraces 0.203: v14.27,23.02 17.92,23.02 19.98,25.08 26.02,25.08 28.08,23.02 29.51,23.02 31.57,25.08 37.76,25.08 39.83,23.02 v48.88,23.02
  Bottom 0.203: v14.27,26.35 13.47,27.15 13.16,27.15 12.04,28.26 12.04,33.02 10.3,34.77 10.3,51.44 9.66,52.07 7.44,52.07 5.06,54.45 5.06,59.84 3.31,61.59 3.31,66.04 v3.63,66.36
N$12
  Top 0.203: SW2.L1 56.18,99.78 R1.1
N$13
  Top 0.203: IC4.9 C24.1 | C24.1 15.41,64.77 R35.2 | C24.1 R41.1 16.53,64.77 R39.2
N$14  (via drill 0.2)
  Top 0.203: v26.02,26.35 26.02,13.39 D5.2 26.81,13.34 28.87,15.4 J3.P3 | R35.1 v17.92,66.04
  Bottom 0.203: v26.02,26.35 19.98,26.35 18.08,28.26 13.31,28.26 13,28.57 13,33.34 11.25,35.08 11.25,51.75 11.89,52.39 11.89,60.01 v17.92,66.04
N$15
  Top 0.203: R82.2 31.77,25.43 30.62,24.29 J3.P2
N$16
  Top 0.203: IC2.6 C11.1 R19.1 6.3,88.9 R16.2 R21.2
N$17  (via drill 0.2)
  Top 0.203: D11.2 60.46,13.34 | 60.46,13.34 61.26,13.34 63.16,15.24 J6.P3 | v60.3,14.61 60.3,13.49 60.46,13.34 | R21.1 v3.06,87.63
  Supplies+LongTraces 0.203: v3.06,87.63 2.52,87.63 1.89,87 1.89,81.44 3.31,80.01 3.31,68.75 2.02,67.45 2.02,65.91 3.63,64.29 3.63,54.45 1.89,52.7 1.89,21.59 5.85,17.62 57.29,17.62 v60.3,14.61
N$18
  Top 0.203: R42.2 R38.2 5.22,64.73 R40.1 C23.1 IC4.6
N$19  (via drill 0.2)
  Top 0.203: v15.22,26.35 15.22,21.91 14.59,21.27 D14.2 14.69,13.97 15.22,13.97 17.44,16.19 J2.P3 | R38.1 3.98,65.44 v4.27,65.72
  Bottom 0.203: v15.22,26.35 13.95,27.62 13.32,27.62 12.52,28.42 12.52,33.17 10.78,34.91 10.78,51.75 9.98,52.55 7.6,52.55 5.54,54.61 5.54,60.01 3.79,61.75 3.79,65.25 v4.27,65.72
N$20
  Top 0.203: R81.2 20.3,26.64 20.3,25.4 19.19,24.29 J2.P2
N$21
  Top 0.203: R29.2 R34.2 17.6,67.34 R31.1 C20.1 IC4.13
N$22  (via drill 0.2)
  Top 0.203: v37.45,27.3 37.45,13.39 D7.2 38.14,13.34 40.3,15.5 J4.P3 | R29.1 19.19,68.58 19.82,67.94 v19.82,66.04
  Bottom 0.203: v37.45,27.3 37.13,26.99 30.62,26.99 29.35,28.26 28.4,28.26 27.13,26.99 20.14,26.99 18.39,28.73 13.63,28.73 13.47,28.89 13.47,33.5 11.73,35.24 11.73,51.59 12.36,52.23 12.36,59.69 18.08,65.41 19.19,65.41 v19.82,66.04
N$23
  Top 0.203: R75.2 42.84,27.94 42.05,27.15 42.05,25.24 41.1,24.29 J4.P2
N$24
  Top 0.203: R80.2 43.18,20.82 41.89,19.53 41.89,11.43 41.89,11.27 J10.P2
N$25
  Top 0.203: R74.1 R79.2 8.59,17.11 11.73,13.97 11.73,9.21 12.68,8.26 20.14,8.26 | D15.2 20.14,8.26 | J8.P3 20.14,4.45 20.14,8.26
N$26
  Top 0.203: R17.2 15.22,88.87 IC2.9
N$27  (via drill 0.2)
  Top 0.203: 43.1,4.55 D8.2 43.16,13.39 v43.16,19.05 | v3.31,84.3 4.9,85.88 12.36,85.88 v12.68,85.57 | v13.32,26.35 v13.32,23.02 | R11.1 v15.38,93.23 | J10.P3 43.1,4.55 | 43.1,4.55 45.95,4.55 R88.2
  Supplies+LongTraces 0.203: v43.16,19.05 31.09,19.05 30.62,18.57 16.65,18.57 13.32,21.91 v13.32,23.02
  Bottom 0.203: v13.32,26.35 11.57,28.1 11.57,32.86 9.82,34.61 9.82,51.28 9.51,51.59 7.28,51.59 4.58,54.29 4.58,59.67 2.84,61.42 2.84,83.82 v3.31,84.3 | v15.38,93.23 13.36,93.23 12.35,92.22 12.35,85.9 v12.68,85.57
N$28
  Top 0.203: R20.2 R15.1 17.58,89.59 16.49,89.59 | IC2.10 14.83,89.52 14.9,89.59 16.49,89.59 | R18.1 16.49,89.59
N$29
  Top 0.203: R11.2 15.07,91.47 IC2.13
N$30
  Top 0.203: R10.2 R14.1 17.42,90.59 16.49,90.59 | R12.1 16.49,90.59 | 16.49,90.59 14.91,90.59 14.68,90.82 IC2.12
N$31
  Top 0.61: R37.1 63.8,66.2 64.12,66.52 64.12,66.98 IC5.3 64.2,68.75 C16.1
N$32
  Top 0.203: R73.1 R78.2 4.74,26.32 4.74,23.81 4.11,23.18 4.11,20 7.6,16.51 7.6,12.54 7.92,12.22 8.81,12.22 D13.2 8.87,4.6 J7.P3
N$33
  Top 0.203: R73.2 2.84,28.13 2.84,29.05 1.89,30 1.89,32.38 | 1.89,32.38 1.89,33.02 2.36,33.5 C43.1 | R71.1 1.92,32.35 1.89,32.38
N$34  (via drill 0.2)
  Top 0.203: v49.99,88.42 49.99,88.11 52.68,85.41 62.21,85.41 65.39,82.23 65.39,75.09 64.12,73.82 v64.12,73.18 | v64.12,63.82 64.12,55.88 67.45,52.55 67.45,46.2 65.7,44.45 65.7,37.15 67.61,35.24 67.61,32.38 66.66,31.43 LED4.A
  Bottom 0.203: v49.99,88.42 43.32,88.42 42.52,87.63 R92.2 | v64.12,73.18 v64.12,63.82
N$35
  Top 0.203: R58.1 43.48,43.22 R60.2 43.44,42.53 42.66,41.75 35.22,41.75 32.94,44.03 C35.2 33.16,45.46 33.16,46.87 R52.2
N$36  (via drill 0.2)
  Top 0.203: R86.2 v22.84,7.62 | v22.84,7.62
  Supplies+LongTraces 0.203: J7.P2 7.44,8.26 22.21,8.26 v22.84,7.62
N$37
  Top 0.203: C51.1 9.79,30.36 IC10.5 9.91,30.48 R72.2
N$38
  Top 0.61: L1.2 44.52,95.34 45.7,96.53 D2.A
N$39
  Top 0.203: R56.1 43.49,45.76 R54.1 41.61,45.76 38.24,42.39 35.54,42.39 34.64,43.28 C35.1 34.43,45.46 34.43,46.87 R53.2
N$40
  Top 0.61: D1.C 43.63,96.36 43.16,95.89 43.16,93.82 43.64,93.34 L2.2 44.52,93.03 45.16,92.39 45.95,92.39 47.86,90.49 L12.2 49.6,90.08 53.73,85.95 62.44,85.95 66.02,82.37 66.02,73.34 62.05,69.37 L5.2
N$41  (via drill 0.2)
  Top 0.203: v31.25,40.48 55.7,40.48 58.4,43.18 58.4,45.4 58.05,45.76 R55.1 57.25,45.72 R57.1 | R51.2 31.73,45.51 C34.1 31.41,45.19 31.41,43.66 v31.25,43.5
  Bottom 0.203: v31.25,40.48 v31.25,43.5
N$42
  Top 0.61: IC6.1 57.22,65.91 C18.1 57.34,68.53 R32.1
N$43
  Top 0.203: C49.1 3.31,29.21 2.68,29.84 R71.2 2.72,31.11 IC10.3
N$44
  Top 0.203: R68.1 5.22,34.45 4.27,33.5 C43.2 4.04,33.46 IC10.1 4.04,32.38 IC10.2
N$45
  Top 0.203: R85.2 21.29,12.42 21.25,12.38 20.93,12.7 20.93,14.61 20.62,14.92 16.97,14.92 16.17,14.13 16.17,10.95 J8.P2 | J8.P2
N$46
  Top 0.203: IC10.6 IC10.7 C44.2 11.13,32.67 9.98,33.81 R70.1
N$47  (via drill 0.2)
  Top 0.203: C28.1 v36.33,45.88 C38.1 | v13.79,40.32 6.97,40.32 6.01,39.37 6.01,36.99 5.5,36.48 R68.2 R67.2 | v21.73,40.32 29.82,40.32 30.3,39.85 v36.33,39.85
  Bottom 0.203: v13.79,40.32 v21.73,40.32 | v36.33,45.88 v36.33,39.85
N$48
  Top 0.203: LED1.2 30.14,73.02 R27.2
N$49
  Top 0.203: C44.1 R72.1 12.33,29.81 10.62,28.1 R74.2
N$50
  Top 0.61: L6.1 59.36,65.2 R37.2
N$51  (via drill 0.2)
  Top 0.305: v36.17,51.59 36.21,51.56 IC7.24
  Bottom 0.406: C56.1 35.86,51.91 v36.17,51.59
  Bottom 0.61: C56.1 37.09,52.59 C55.1 38.8,52.24 L11.2
N$52
  Top 0.406: R77.1 59.67,19.53 60.78,18.41 64.12,18.41 65.49,17.04 D12.2 65.49,4.07 J12.P3
N$53  (via drill 0.2)
  Top 0.203: C29.1 v38.4,45.88 C39.1 | v14.43,39.69 11.41,39.69 10.78,39.05 10.78,37.17 10.08,36.48 R70.2 R69.2 | v21.09,39.69 29.67,39.69 30.14,39.21 v38.4,39.21
  Bottom 0.203: v14.43,39.69 v21.09,39.69 | v38.4,45.88 v38.4,39.21
N$54
  Top 0.203: R84.2 66.06,25.28 65.07,24.29 J6.P2
N$55
  Top 0.406: R76.1 57.45,19.37 54.53,16.45 D10.2 54.53,9.68 | J11.P3 54.53,4.55 54.53,9.68 | J12.P2 | J12.P2 54.53,9.68
N$56
  Top 0.61: JP1.2 JP1.1 D2.C
N$57
  Top 0.61: L12.1 52.63,89.06 L4.1
N$58
  Top 0.203: IC9.2 45.53,45.41 45.22,45.72 R56.2 44.72,46.98 C31.1
N$59
  Top 0.203: R54.2 42.24,46.99 C31.2 43.51,47.52 43.78,47.78 46.27,47.78
  Top 0.406: R76.2 57.45,35.54 61.26,39.35 61.26,44.61 58.08,47.78 56.02,47.78 55.22,48.58 53.16,48.58 52.68,48.1 46.58,48.1 46.27,47.78 IC9.1
N$60
  Top 0.203: C32.1 R57.2 53.03,44.76 IC9.6
N$61  (via drill 0.2)
  Top 0.406: v56.34,48.58 58.08,48.58 61.89,44.76 61.89,39.05 58.08,35.24 58.08,30.85 59.67,29.27 R77.2 | IC9.7 52.85,45.41 53.16,45.72 53.16,47.5 53.48,47.82 54.88,47.82 55.19,47.5 C32.2 v56.34,46.99 57.25,46.99 R55.2
  Bottom 0.406: v56.34,46.99 v56.34,48.58
N$62
  Top 0.203: IC9.3 45.54,44.77 45.19,44.41 R58.2 43.48,44.41 C37.1
N$63
  Top 0.203: R50.2 30.46,46.2 29.77,45.51 C34.2 29.93,45.09 29.93,43.71 32.52,41.12 52.53,41.12 53.8,42.39 R59.1 55.07,43.06 R61.2
N$64
  Top 0.61: L5.1 61.31,68.58 R32.2
N$65
  Top 0.203: IC7.20 33.61,49.08 34.27,48.42 R53.1
N$66
  Top 0.203: IC7.19 32.96,48.26 R52.1
N$67  (via drill 0.2)
  Top 0.203: IC7.7 34.91,57.32 v35.06,57.47
  Bottom 0.406: v35.06,57.47 C58.1
  Bottom 0.61: L7.2 31.96,58.74 C59.1 33.75,58.47 C58.1
N$68
  Top 0.203: IC7.18 32.31,49.32 31.73,48.74 R51.1
N$69
  Top 0.203: IC7.17 31.66,49.3 30.58,48.23 R50.1
N$70
  Top 0.203: SW1.L1 2.84,99.61 R4.1
N$71  (via drill 0.2)
  Top 0.203: v44.43,87.15 43.79,86.52 39.98,86.52 38.87,87.63 35.7,87.63 34.9,88.42 28.55,88.42 22.52,82.39 22.52,70.8 23.79,69.53 23.79,60.8 21.09,58.1 21.09,55.4 14.59,48.9 11.89,48.9 10.14,47.15 10.14,42.86 11.41,41.59 14.9,41.59 15.06,41.43 15.06,33.5 13.47,31.91 13.47,28.1 12.36,26.99 12.36,13.34 LED5.A
  Bottom 0.203: R91.2 v44.43,87.15
N$73
  Top 0.203: R48.2 39.95,50.2 39.67,50.48 38.85,50.48 IC7.28
N$75
  Top 0.203: LED1.3 29.03,74.46 R25.2
N$76
  Top 0.203: R26.2 26.02,73.48 LED1.4
N$77  (via drill 0.2)
  Top 0.203: v40.3,87.15 39.35,88.11 36.02,88.11 35.22,88.9 28.4,88.9 22.05,82.55 22.05,69.22 22.84,68.42 22.84,61.12 20.3,58.58 18.08,58.58 17.12,57.63 17.12,52.7 14.29,49.87 11.59,49.87 9.35,47.62 LED2.A
  Bottom 0.203: v40.3,87.15 R94.2
N$78  (via drill 0.2)
  Top 0.203: v49.19,89.22 49.19,88.27 52.55,84.91 62.07,84.91 64.88,82.09 64.88,75.41 63.16,73.69 v63.16,73.18 | v63.16,63.82 63.16,56.2 67,52.36 67,48.1 66.52,47.62 LED3.A
  Bottom 0.203: v63.16,73.18 v63.16,63.82 | R93.2 41.41,87 43.18,88.77 48.74,88.77 v49.19,89.22
N$79
  Top 0.61: JP1.10 JP1.9 39.35,99.06 39.83,98.58 D1.A
N$80
  Top 0.203: IC1.2 57.28,92.4 58.43,91.25 C10.1
N$81
  Top 0.406: IC1.6 62.96,91.75 C5.2
  Top 0.61: L3.1 63.35,91.36 62.96,91.75
N$82  (via drill 0.2)
  Top 0.203: v34.27,51.59 v34.26,51.59
  Top 0.305: v34.26,51.59 IC7.21
  Bottom 0.406: C53.1 34.59,51.91 | 34.59,51.91 | 34.59,51.91 v34.27,51.59 | v34.27,51.59
  Bottom 0.61: C54.1 33.35,52.57 C53.1
N$83
  Top 0.406: IC1.7 62.04,92.4 62.64,92.99 C5.1
N$84
  Top 0.203: IC1.1 57.31,93.05 58.52,94.26 R5.1 R6.2
NORMALIZATION_PROBE  (via drill 0.2)
  Top 0.203: v3.79,24.92 2.2,24.92 1.41,25.72 1.41,47.94 2.04,48.58 9.66,48.58 11.41,50.32 14.11,50.32 16.62,52.84 16.62,57.77 17.78,58.92 20.01,58.92 22.36,61.28 22.36,64.61 21.57,65.41 21.57,68.41 20.93,69.05 v20.93,77.47 | R82.1 32.96,25.75 v33,25.72 | R75.1 R80.1 44.38,25.76 v44.43,25.72 | R81.1 21.54,25.75 v21.57,25.72 21.57,24.77 21.89,24.45 21.89,14.92 21.73,14.76 R85.1 21.74,13.61 R86.1 | R84.1 67.26,25.84 v67.13,25.72 | v55.86,25.72 55.86,26.64 R83.1
  Top 0.61: D3.3 v28.08,77.47
  Supplies+LongTraces 0.203: v3.79,24.92 4.43,25.56 8.87,25.56 9.03,25.4 9.98,25.4 10.14,25.56 19.51,25.56 19.66,25.72 v21.57,25.72 v33,25.72 v44.43,25.72 v55.86,25.72 v67.13,25.72
  Bottom 0.203: IC11.45 28.08,77.8 | 28.08,77.8 22.21,77.8 21.88,77.47 v20.93,77.47 | v28.08,77.47 28.08,77.8
OSC_IN
  Bottom 0.203: IC11.12 42.07,64.91 42.39,64.59 42.39,61.09 43.16,60.33 46.49,60.33 46.9,59.92 Q1.3
  Bottom 0.406: Q1.3 47.12,59.25 C60.1
OSC_OUT
  Bottom 0.203: R90.1 41.73,64.45 41.57,64.61 IC11.13
PITCH_AMT_POT
  Top 0.203: R66.P$2 51.73,31.43 51.1,32.07 46.97,32.07 | IC8.2 11.92,47.66 11.09,46.83 11.09,43.18 11.73,42.55 15.22,42.55 16.01,41.75 16.01,33.18 16.65,32.54 33.95,32.54 34.43,32.07 46.97,32.07 | C48.1 46.97,32.07
PITCH_CV  (via drill 0.2)
  Top 0.203: v21.09,63.5 20.3,63.5 18.71,61.91 3,61.91 2.36,62.55 2.36,68.9 2.84,69.37 5.85,69.37 6.33,68.9 R30.2 C19.2 8.01,68.55 IC4.1
  Bottom 0.203: v21.09,63.5 30.46,63.5 31.73,64.77 35.38,64.77 36.07,65.46 IC11.24
PITCH_POT  (via drill 0.2)
  Top 0.203: v27.92,69.81 27.92,65.72 28.71,64.93 34.9,64.93 36.02,66.04 47.13,66.04 50.94,69.85 50.94,71.91 52.65,73.62 C15.1 53.67,73.66 57.92,73.66 58.4,73.18 R23.P$2
  Bottom 0.203: IC11.30 28.37,70.3 27.92,69.85 v27.92,69.81
POSITION_AMT_POT  (via drill 0.2)
  Top 0.203: R63.P$2 17.44,31.11 17.92,31.59 21.57,31.59 22.05,31.11 C45.1 | IC8.12 18.73,45.7 18.87,45.56 18.87,43.18 17.44,41.75 v17.44,33.97
  Bottom 0.203: v17.44,33.97 R63.P$2
POSITION_CV  (via drill 0.2)
  Top 0.203: v21.73,64.14 20.3,64.14 18.55,62.39 7.92,62.39 7.44,62.87 C23.2 | R40.2 C23.2 | IC4.7 8.01,63.53 C23.2
  Bottom 0.203: v21.73,64.14 30.3,64.14 31.41,65.25 35.22,65.25 35.57,65.6 IC11.25
POSITION_POT  (via drill 0.2)
  Top 0.203: v20.34,70.01 11.55,70.01 10.78,70.79 R22.P$2 10.78,73.18 11.22,73.62 C14.1
  Bottom 0.203: IC11.28 28.79,69.3 27.76,68.26 23,68.26 21.25,70.01 v20.34,70.01
POT_MUX  (via drill 0.2)
  Top 0.203: IC8.3 14.12,47.01 14.74,47.62 14.74,48.42 21.57,55.24 21.57,57.94 24.43,60.8 v24.43,61.44 | v28.08,61.44 39.51,61.44 v39.67,61.59
  Bottom 0.203: v24.43,61.44 v28.08,61.44 | v39.67,61.59 39.67,63.66 39.54,63.78 C64.1 39.03,65.09 39.07,65.13 IC11.18
POT_MUX_S0  (via drill 0.2)
  Top 0.203: IC8.11 16.84,45.05 16.17,45.72 16.17,47.94 23,54.77 23,57.47 26.02,60.48 26.02,69.85 24.43,71.44 24.43,80.96 27.29,83.82 37.13,83.82 v37.29,83.66
  Bottom 0.203: IC11.55 37.57,83.38 v37.29,83.66
POT_MUX_S1  (via drill 0.2)
  Top 0.203: IC8.10 16.68,44.41 15.7,45.39 15.7,48.1 22.52,54.93 22.52,57.65 25.54,60.67 25.54,69.69 23.95,71.28 23.95,81.12 27.13,84.3 37.92,84.3 v38.08,84.14
  Bottom 0.203: IC11.56 38.07,83.19 38.08,83.19 v38.08,84.14
POT_MUX_S2  (via drill 0.2)
  Top 0.203: IC8.9 16.55,43.76 15.22,45.09 15.22,48.26 22.05,55.09 22.05,57.78 25.06,60.8 25.06,69.53 23.48,71.12 23.48,81.28 26.97,84.77 v38.71,84.77
  Bottom 0.203: IC11.57 38.57,83.49 38.71,83.63 v38.71,84.77
RESET  (via drill 0.2)
  Top 0.203: v22.84,93.98 21.57,92.71 21.57,69.06 22.21,68.42 22.21,66.08 v22.16,66.04 | v41.57,68.26 41.57,67.94 40.14,66.52 34.43,66.52 | 34.43,66.52 31.57,66.52 31.12,66.06 v28.69,66.06 | R36.2 34.43,65.92 34.43,66.52
  Bottom 0.203: JP2.4 v22.84,93.98 | C63.1 40.62,64.49 41.07,64.94 IC11.14 41.1,66.32 41.1,67.79 v41.57,68.26 | v28.69,66.06 22.23,66.06 22.21,66.04 v22.16,66.04
REVERB_POT  (via drill 0.2)
  Top 0.203: IC8.15 18.84,47.66 20.62,45.88 20.62,43.66 18.71,41.75 18.71,34.92 20.14,33.5 54.43,33.5 55.38,32.54 v55.86,32.54 | R62.P$2 63.16,33.02 62.43,32.28 61.54,32.28 61.45,32.19 C52.1 59.23,32.19 v58.88,32.54
  Bottom 0.203: v55.86,32.54 v58.88,32.54
RX  (via drill 0.2)
  Top 0.203: v46.18,87.79 46.18,88.11 44.75,89.53 41.89,89.53 41.1,90.33 38.08,90.33 30.62,97.79 20.62,97.79 19.66,98.74 R3.2
  Bottom 0.203: IC11.69 44.57,83.49 46.18,85.09 v46.18,87.79
SEED  (via drill 0.2)
  Top 0.203: v20.93,78.42 20.93,92.87 19.98,93.82 16.49,93.82 | 16.49,93.82 15,93.82 14.24,93.06 IC2.14 | R12.2 16.49,93.82
  Bottom 0.203: v20.93,78.42 21.06,78.3 IC11.46
SEED_LED  (via drill 0.2)
  Top 0.203: v41.57,92.39 41.57,94.14 40.46,95.25 39.03,95.25 37.29,97 37.29,103.35 38.71,104.78 55.22,104.78 56.18,103.82 R1.2 | v43.79,87.79 43.03,88.56 41.25,88.56 40.62,89.19 v40.62,89.22
  Bottom 0.203: IC11.64 42.07,83.32 42.55,83.8 42.83,83.8 43.79,84.76 v43.79,87.79 | v41.57,92.39 41.57,90.17 v40.62,89.22
SEED_SW  (via drill 0.2)
  Top 0.203: 61.26,98.74 SW2.P5 | 61.26,98.74 SW2.P2 | 61.26,98.74 55.7,98.74 50.14,104.3 39.03,104.3 37.76,103.03 37.76,97.16 39.19,95.73 40.62,95.73 42.52,93.82 v42.52,92.39 | v47.45,87.79 47.45,88.42 45.22,90.65 v42.52,90.65
  Bottom 0.203: IC11.71 45.57,83.22 47.45,85.09 v47.45,87.79 | v42.52,92.39 v42.52,90.65
SHAPE_AMT_POT  (via drill 0.2)
  Top 0.203: R65.P$2 40.3,31.43 40.46,31.59 44.91,31.59 45.22,31.27 C47.1 | IC8.5 11.71,45.7 11.57,45.56 11.57,43.34 11.89,43.02 15.38,43.02 16.49,41.91 16.49,33.5 16.97,33.02 39.98,33.02 v40.3,32.7
  Bottom 0.203: v40.3,32.7 R65.P$2
  Bottom 0.21: R65.P$2
SHAPE_CV  (via drill 0.2)
  Top 0.203: v39.51,68.26 39.51,67.94 39.19,67.63 v28.87,67.63 | C20.2 14.79,68.55 IC4.14 | C20.2 R31.2 | C20.2 15.38,69.37 15.54,69.53 18.71,69.53 19.82,69.53 20.93,68.42 20.93,67.63 v20.98,67.63
  Bottom 0.203: v39.51,68.26 40.07,67.7 IC11.16 | v20.98,67.63 v28.87,67.63
SHAPE_POT  (via drill 0.2)
  Top 0.203: v26.65,70.64 27.29,70.01 27.29,69.37 26.97,69.06 26.97,60.17 26.02,59.21 26.02,53.82 27.44,52.39 v27.44,46.51 | v39.83,46.04 39.83,47.94 40.3,48.42 45.22,48.42 45.7,48.9 R45.P$2 45.7,51.42 46.16,51.88 C25.1
  Supplies+LongTraces 0.203: v27.44,46.51 39.35,46.51 v39.83,46.04
  Bottom 0.203: IC11.32 33.54,71.27 27.27,71.27 v26.65,70.64
SIZE_AMT_POT
  Top 0.203: R64.P$2 28.87,32.07 | IC8.1 11.93,48.3 10.62,46.99 10.62,43.02 11.57,42.07 15.06,42.07 15.54,41.59 15.54,33.02 16.49,32.07 28.87,32.07 | C46.1 33.48,31.59 33,32.07 28.87,32.07
SIZE_CV  (via drill 0.2)
  Top 0.203: v40.46,68.26 40.46,67.63 39.83,66.99 30.46,66.99 v30.3,66.83 | v21.09,64.77 20.3,64.77 19.03,63.5 16.53,63.5 R41.2 C24.2 14.81,63.53 IC4.8
  Bottom 0.203: v40.46,68.26 40.57,68.15 IC11.15 | v30.3,66.83 28.24,64.77 v21.09,64.77
SIZE_POT  (via drill 0.2)
  Top 0.203: v26.65,69.69 26.49,69.53 26.49,60.33 23.48,57.31 R44.P$2 23.48,48.3 C33.1
  Bottom 0.203: v26.65,69.69 27.75,70.8 IC11.31
SWCLK  (via drill 0.2)
  Top 0.203: v48.72,87.79 48.72,88.58 45.54,91.76 38.56,91.76 33,97.31 33,104.14 32.05,105.09 25.7,105.09 25.38,104.78 JP2.3
  Bottom 0.203: v48.72,87.79 48.72,85.25 49.19,84.77 51.26,84.77 51.73,84.3 51.73,81.12 50.91,80.3 IC11.76
SWDIO  (via drill 0.2)
  Top 0.203: v48.08,87.15 48.08,88.42 45.22,91.28 38.4,91.28 27.92,101.76 JP2.2
  Bottom 0.203: IC11.72 46.07,83.08 48.08,85.09 v48.08,87.15
TX  (via drill 0.2)
  Top 0.203: v45.54,87.15 45.54,87.95 44.43,89.06 41.73,89.06 40.94,89.85 37.93,89.85 30.47,97.31 19.98,97.31 18.55,98.74 R2.2
  Bottom 0.203: IC11.68 44.07,83.62 45.54,85.09 v45.54,87.15
VCAP_1
  Bottom 0.305: IC11.48 32.29,79.3 32.05,79.53 C69.1
VCAP_2
  Bottom 0.203: IC11.73 46.57,83.06 47.33,83.82 C72.1
VCC  (via drill 0.2)
  Top 0.203: 8.58,32.41 v8.55,32.38
  Top 0.305: IC10.8 8.58,32.41 | IC9.8 50.96,46.06 v50.94,46.04
  Top 0.406: C42.1 8.58,33.44 8.58,32.41 | v50.94,46.04 50.94,47.11 C30.1
  Top 0.61: L2.1 46.65,93.34 v47.13,92.87 C2.1
  Supplies+LongTraces 0.61: v8.55,32.38 11.09,34.92 11.09,52.07 16.49,57.47 16.49,60.96 | 16.49,60.96 16.49,74.79 11.73,79.55 11.73,92.23 15.22,95.73 44.27,95.73 v47.13,92.87 | v50.94,46.04 45.22,46.04 43,48.26 32.36,48.26 26.02,54.61 26.02,57.63 22.68,60.96 16.49,60.96
VEE  (via drill 0.2)
  Top 0.203: 5.38,30.46 v5.38,30.48 | 47.42,44.11 v47.45,44.13
  Top 0.305: IC10.4 5.38,30.46 | IC9.4 47.42,44.11
  Top 0.406: 5.38,30.46 5.56,30.46 6.17,29.84 6.17,29.25 C50.2 | C41.2 47.48,44.1 v47.45,44.13
  Top 0.61: L1.1 v47.13,95.25 48.08,95.25 C1.2 | R24.1 13.03,76.64 v10.78,78.9 | v19.82,60.01 v15.22,60.01
  Supplies+LongTraces 0.61: v47.45,44.13 45.86,44.13 42.68,47.31 31.89,47.31 25.06,54.13 25.06,57.15 22.21,60.01 v19.82,60.01 | v5.38,30.48 9.98,35.08 9.98,52.55 15.22,57.78 v15.22,60.01 15.22,70.63 14.74,71.11 14.74,74.94 v10.78,78.9 10.78,92.55 14.9,96.68 45.7,96.68 v47.13,95.25
WET_POT  (via drill 0.2)
  Top 0.203: IC8.14 18.86,47.01 19.98,45.88 v19.98,45.4 | v58.88,33.5 58.88,35.08 62.53,38.73 62.53,45.09 63.16,45.72 R46.P$2 63.16,51.44 62.69,51.91 58.28,51.91 C26.1 | v21.25,45.4 21.25,43.66 19.19,41.59 19.19,35.08 20.3,33.97 54.83,33.97 55.3,33.5 v55.86,33.5
  Bottom 0.203: v19.98,45.4 v21.25,45.4 | v55.86,33.5 v58.88,33.5

## Text on the board
tPlace: Beads | cc-by-sa | Fred's lab & | Émilie Gillet | 2021 v5
bPlace: Stripe | Red | +12V | GND | -12V | Beads | cc-by-sa | Fred's lab & Émilie Gillet | 2021 v5